# Altium schematic sheet TIA.SchDoc: 08 - Fotodeteccao InGaAs e filtro
size A3; Project: CM5 Photonic Bias Controller; DocumentRev: R5; ProjectRev: R5; Version: Rev R6; SheetNumber: 9; SheetTotal: 17; Author: Carlos Renan; SCH_SCALE: N/A; Address1: UFCG; Address2: Referencia: VIRTUS CC; Address3: Campina Grande - PB; ProjectName: Controle automatico de BIAS para MZM/IQ - Projeto 3; DocumentName: TIA.SchDoc
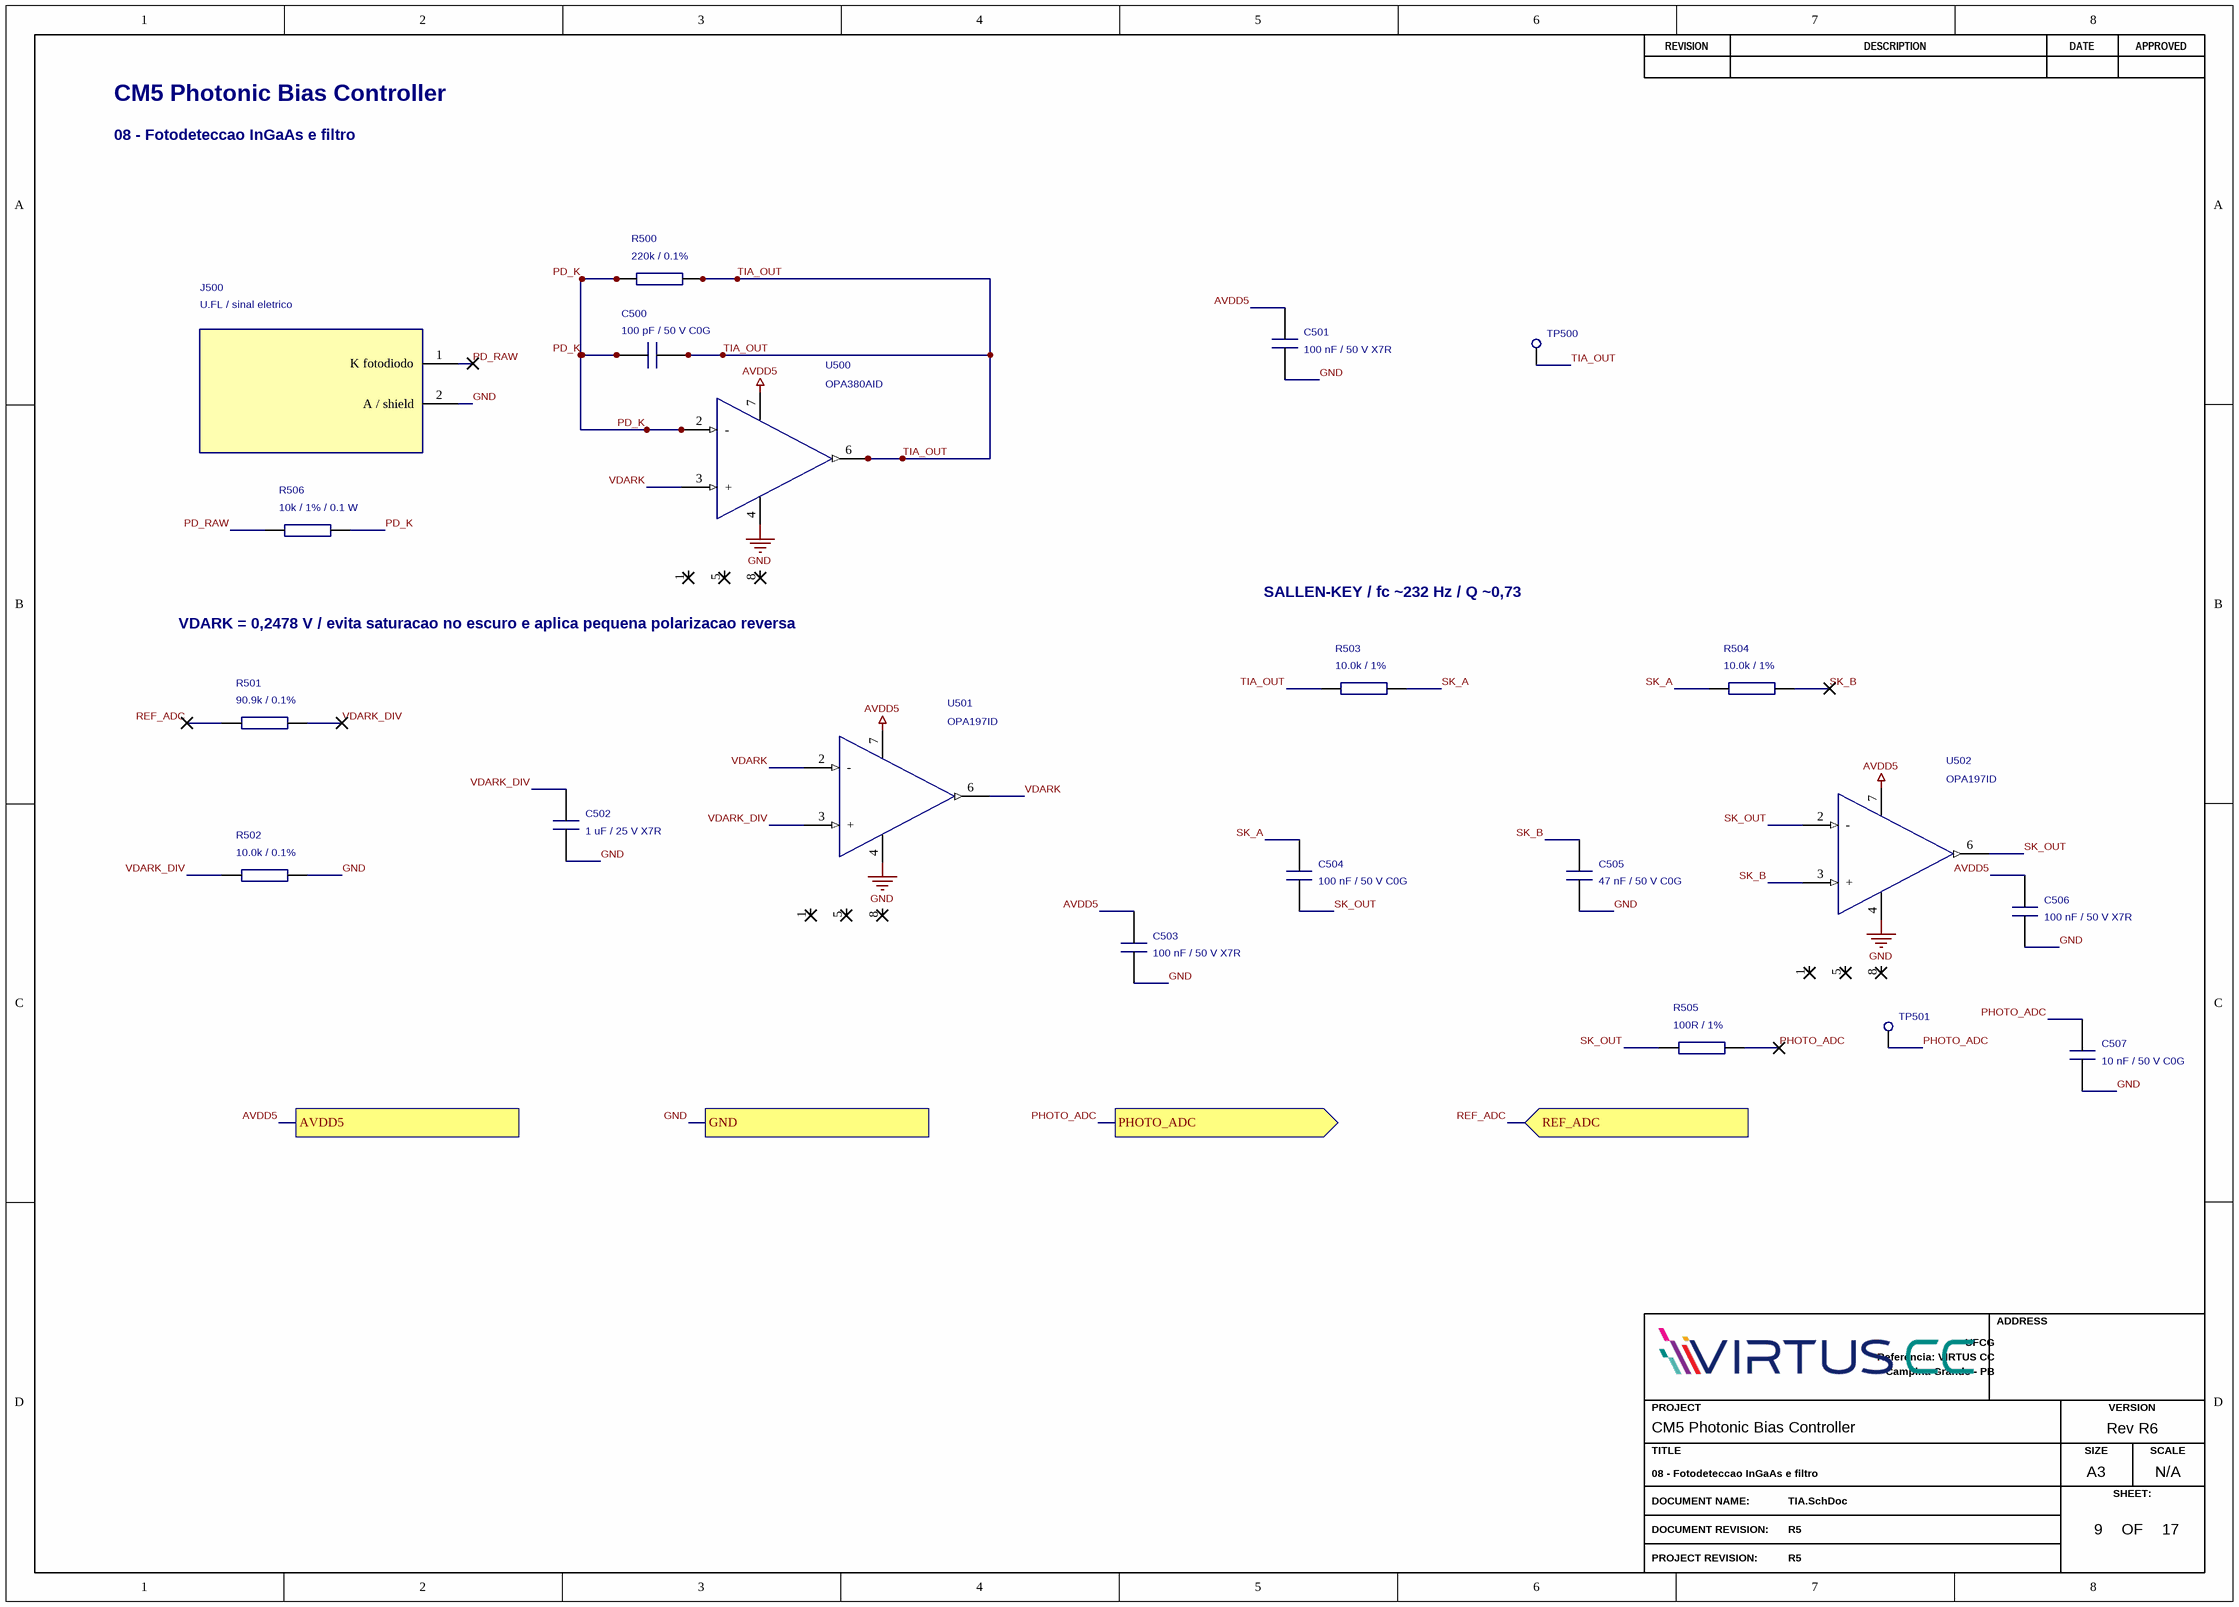
[diagram p0: TIA.SchDoc]

## Parts
C500  100 pF / 50 V C0G  [C0805]
C501  100 nF / 50 V X7R  [C0805]
C502  1 uF / 25 V X7R  [C0805]
C503  100 nF / 50 V X7R  [C0805]
C504  100 nF / 50 V C0G  [C1206]
C505  47 nF / 50 V C0G  [C1206]
C506  100 nF / 50 V X7R  [C0805]
C507  10 nF / 50 V C0G  [C0805]
J500  U.FL / sinal eletrico  [HIROSE_UFL]
R500  220k / 0.1%  [R-0603]
R501  90.9k / 0.1%  [R-0603]
R502  10.0k / 0.1%  [R-0603]
R503  10.0k / 1%  [R-0603]
R504  10.0k / 1%  [R-0603]
R505  100R / 1%  [R-0603]
R506  10k / 1% / 0.1 W  [R-0603]
TP500  Testpoint  [TP06R]  (value not drawn)
TP501  Testpoint  [TP06R]  (value not drawn)
U500  OPA380AID  [SOIC8]
U501  OPA197ID  [SOIC8]
U502  OPA197ID  [SOIC8]

## Ports
AVDD5, GND, PHOTO_ADC (out), REF_ADC (in)

## Nets
AVDD5: C501.1 C503.1 C506.1 U500.7(V+) U501.7(V+) U502.7(V+) ; port AVDD5
GND: C501.2 C502.2 C503.2 C505.2 C506.2 C507.2 J500.2(A_/_shield) R502.2 U500.4(V-) U501.4(V-) U502.4(V-) ; port GND
PD_K: C500.1 R500.1 R506.2 U500.2(-)
PD_RAW: J500.1(K_fotodiodo) R506.1
PHOTO_ADC: C507.1 R505.2 TP501.1(TP) ; port PHOTO_ADC
REF_ADC: R501.1 ; port REF_ADC
SK_A: C504.1 R503.2 R504.1
SK_B: C505.1 R504.2 U502.3(+)
SK_OUT: C504.2 R505.1 U502.2(-) U502.6(OUT)
TIA_OUT: C500.2 R500.2 R503.1 TP500.1(TP) U500.6(OUT)
VDARK: U500.3(+) U501.2(-) U501.6(OUT)
VDARK_DIV: C502.1 R501.2 R502.1 U501.3(+)

Not connected (* = marked no-connect by the designer): U500 1(NC)* 5(NC)* 8(NC)*; U501 1(NC)* 5(NC)* 8(NC)*; U502 1(NC)* 5(NC)* 8(NC)*

## Notes on the sheet
- CM5 Photonic Bias Controller
- 08 - Fotodeteccao InGaAs e filtro
- SALLEN-KEY / fc ~232 Hz / Q ~0,73
- (near U500) VDARK = 0,2478 V / evita saturacao no escuro e aplica pequena polarizacao reversa
- REVISION
- DESCRIPTION
- DATE
- APPROVED
- ADDRESS
- PROJECT
- VERSION
- TITLE
- A3
- SIZE
- SCALE
- DOCUMENT NAME:
- DOCUMENT REVISION:
- OF
- SHEET:
- PROJECT REVISION:

## Library data of the parts
C500 = 100 pF: Manufacturer: KEMET; Manufacturer Part Number: C0805C101J5GACTU; Procurement Status: Busca por MPN; SKU e disponibilidade a confirmar; BOM Purchase: Yes; Manufacturer 1: KEMET; Manufacturer Part Number 1: C0805C101J5GACTU; Supplier 1: DigiKey; Supplier URL 1: https://www.digikey.com.br/pt/products/result?keywords=C0805C101J5GACTU; Supplier 2: Mouser; Supplier URL 2: https://br.mouser.com/c/?q=C0805C101J5GACTU; Datasheet: https://www.yageogroup.com/download/specsheet/C0805C101J5GACTU
C501 C503 C506 = 100 nF: Manufacturer: KEMET; Manufacturer Part Number: C0805C104K5RACTU; Procurement Status: Busca por MPN; SKU e disponibilidade a confirmar; BOM Purchase: Yes; Manufacturer 1: KEMET; Manufacturer Part Number 1: C0805C104K5RACTU; Supplier 1: DigiKey; Supplier URL 1: https://www.digikey.com.br/pt/products/result?keywords=C0805C104K5RACTU; Supplier 2: Mouser; Supplier URL 2: https://br.mouser.com/c/?q=C0805C104K5RACTU; Datasheet: https://www.yageogroup.com/download/specsheet/C0805C104K5RACTU
C502 = 1 uF: Manufacturer: KEMET; Manufacturer Part Number: C0805C105K3RACTU; Procurement Status: Busca por MPN; SKU e disponibilidade a confirmar; BOM Purchase: Yes; Manufacturer 1: KEMET; Manufacturer Part Number 1: C0805C105K3RACTU; Supplier 1: DigiKey; Supplier URL 1: https://www.digikey.com.br/pt/products/result?keywords=C0805C105K3RACTU; Supplier 2: Mouser; Supplier URL 2: https://br.mouser.com/c/?q=C0805C105K3RACTU; Datasheet: https://www.yageogroup.com/download/specsheet/C0805C105K3RACTU
C504 = 100 nF: Manufacturer: KEMET; Manufacturer Part Number: C1206C104J5GACTU; Procurement Status: Busca por MPN; SKU e disponibilidade a confirmar; BOM Purchase: Yes; Manufacturer 1: KEMET; Manufacturer Part Number 1: C1206C104J5GACTU; Supplier 1: DigiKey; Supplier URL 1: https://www.digikey.com.br/pt/products/result?keywords=C1206C104J5GACTU; Supplier 2: Mouser; Supplier URL 2: https://br.mouser.com/c/?q=C1206C104J5GACTU; Datasheet: https://www.yageogroup.com/download/specsheet/C1206C104J5GACTU
C505 = 47 nF: Manufacturer: KEMET; Manufacturer Part Number: C1206C473J5GACTU; Procurement Status: Busca por MPN; SKU e disponibilidade a confirmar; BOM Purchase: Yes; Manufacturer 1: KEMET; Manufacturer Part Number 1: C1206C473J5GACTU; Supplier 1: DigiKey; Supplier URL 1: https://www.digikey.com.br/pt/products/result?keywords=C1206C473J5GACTU; Supplier 2: Mouser; Supplier URL 2: https://br.mouser.com/c/?q=C1206C473J5GACTU; Datasheet: https://www.yageogroup.com/download/specsheet/C1206C473J5GACTU
C507 = 10 nF: Manufacturer: KEMET; Manufacturer Part Number: C0805C103J5GACTU; Procurement Status: Busca por MPN; SKU e disponibilidade a confirmar; BOM Purchase: Yes; Manufacturer 1: KEMET; Manufacturer Part Number 1: C0805C103J5GACTU; Supplier 1: DigiKey; Supplier URL 1: https://www.digikey.com.br/pt/products/result?keywords=C0805C103J5GACTU; Supplier 2: Mouser; Supplier URL 2: https://br.mouser.com/c/?q=C0805C103J5GACTU; Datasheet: https://www.yageogroup.com/download/specsheet/C0805C103J5GACTU
J500 = U.FL: Manufacturer: Hirose; Manufacturer Part Number: U.FL-R-SMT-1(10); Review: Centro=1; pads de blindagem=2; conector eletrico do fotodiodo externo.; Procurement Status: Busca por MPN; SKU e disponibilidade a confirmar; BOM Purchase: Yes; Manufacturer 1: Hirose; Manufacturer Part Number 1: U.FL-R-SMT-1(10); Supplier 1: DigiKey; Supplier URL 1: https://www.digikey.com.br/pt/products/result?keywords=U.FL-R-SMT-1%2810%29; Supplier 2: Mouser; Supplier URL 2: https://br.mouser.com/c/?q=U.FL-R-SMT-1%2810%29; Datasheet: https://www.hirose.com/product/series/U.FL
R500 = 220k: Manufacturer: YAGEO; Manufacturer Part Number: RT0603BRD07220KL; Review: Filme fino, 0,1%, 25 ppm/K; 0,1 W. Verificar dissipacao em R210/R212 e matching dos drivers.; Procurement Status: Busca por MPN; SKU e disponibilidade a confirmar; BOM Purchase: Yes; Manufacturer 1: YAGEO; Manufacturer Part Number 1: RT0603BRD07220KL; Supplier 1: DigiKey; Supplier URL 1: https://www.digikey.com.br/pt/products/result?keywords=RT0603BRD07220KL; Supplier 2: Mouser; Supplier URL 2: https://br.mouser.com/c/?q=RT0603BRD07220KL; Datasheet: https://www.yageo.com/en/Product/Index/rchip
R501 = 90.9k: Manufacturer: YAGEO; Manufacturer Part Number: RT0603BRD0790K9L; Review: Filme fino, 0,1%, 25 ppm/K; 0,1 W. Verificar dissipacao em R210/R212 e matching dos drivers.; Procurement Status: SKU conferido; consultar disponibilidade; BOM Purchase: Yes; Manufacturer 1: YAGEO; Manufacturer Part Number 1: RT0603BRD0790K9L; Supplier 1: DigiKey; Supplier Part Number 1: YAG1747CT-ND; Supplier URL 1: https://www.digikey.com.br/en/products/detail/yageo/RT0603BRD0790K9L/1072677; Supplier 2: Mouser; Supplier URL 2: https://br.mouser.com/c/?q=RT0603BRD0790K9L; Datasheet: https://www.yageo.com/en/Product/Index/rchip
R502 = 10.0k: Manufacturer: YAGEO; Manufacturer Part Number: RT0603BRD0710KL; Review: Filme fino, 0,1%, 25 ppm/K; 0,1 W. Verificar dissipacao em R210/R212 e matching dos drivers.; Procurement Status: Busca por MPN; SKU e disponibilidade a confirmar; BOM Purchase: Yes; Manufacturer 1: YAGEO; Manufacturer Part Number 1: RT0603BRD0710KL; Supplier 1: DigiKey; Supplier URL 1: https://www.digikey.com.br/pt/products/result?keywords=RT0603BRD0710KL; Supplier 2: Mouser; Supplier URL 2: https://br.mouser.com/c/?q=RT0603BRD0710KL; Datasheet: https://www.yageo.com/en/Product/Index/rchip
R503 R504 = 10.0k: Manufacturer: YAGEO; Manufacturer Part Number: RC0603FR-0710KL; Procurement Status: Busca por MPN; SKU e disponibilidade a confirmar; BOM Purchase: Yes; Manufacturer 1: YAGEO; Manufacturer Part Number 1: RC0603FR-0710KL; Supplier 1: DigiKey; Supplier URL 1: https://www.digikey.com.br/pt/products/result?keywords=RC0603FR-0710KL; Supplier 2: Mouser; Supplier URL 2: https://br.mouser.com/c/?q=RC0603FR-0710KL; Datasheet: https://www.yageo.com/en/Product/Index/rchip
R505 = 100R: Manufacturer: YAGEO; Manufacturer Part Number: RC0603FR-07100RL; Procurement Status: Busca por MPN; SKU e disponibilidade a confirmar; BOM Purchase: Yes; Manufacturer 1: YAGEO; Manufacturer Part Number 1: RC0603FR-07100RL; Supplier 1: DigiKey; Supplier URL 1: https://www.digikey.com.br/pt/products/result?keywords=RC0603FR-07100RL; Supplier 2: Mouser; Supplier URL 2: https://br.mouser.com/c/?q=RC0603FR-07100RL; Datasheet: https://www.yageo.com/en/Product/Index/rchip
R506 = 10k: Manufacturer: YAGEO; Manufacturer Part Number: RC0603FR-0710KL; Procurement Status: Busca por MPN; SKU e disponibilidade a confirmar; BOM Purchase: Yes; Manufacturer 1: YAGEO; Manufacturer Part Number 1: RC0603FR-0710KL; Supplier 1: DigiKey; Supplier URL 1: https://www.digikey.com.br/pt/products/result?keywords=RC0603FR-0710KL; Supplier 2: Mouser; Supplier URL 2: https://br.mouser.com/c/?q=RC0603FR-0710KL; Datasheet: https://www.yageo.com/en/Product/Index/rchip
TP500 TP501 = Testpoint: Review: Testpoint em cobre; excluido da BOM de compra.; Procurement Status: Recurso de cobre da PCB; nao comprar; BOM Purchase: No - PCB feature
U500 = OPA380AID: Manufacturer: Texas Instruments; Procurement Status: Busca por MPN; SKU e disponibilidade a confirmar; BOM Purchase: Yes; Manufacturer Part Number: OPA380AID; Manufacturer 1: Texas Instruments; Manufacturer Part Number 1: OPA380AID; Supplier 1: DigiKey; Supplier URL 1: https://www.digikey.com.br/pt/products/result?keywords=OPA380AID; Supplier 2: Mouser; Supplier URL 2: https://br.mouser.com/c/?q=OPA380AID; Datasheet: https://www.ti.com/lit/ds/symlink/opa380.pdf
U501 U502 = OPA197ID: Manufacturer: Texas Instruments; Procurement Status: Busca por MPN; SKU e disponibilidade a confirmar; BOM Purchase: Yes; Manufacturer Part Number: OPA197ID; Manufacturer 1: Texas Instruments; Manufacturer Part Number 1: OPA197ID; Supplier 1: DigiKey; Supplier URL 1: https://www.digikey.com.br/pt/products/result?keywords=OPA197ID; Supplier 2: Mouser; Supplier URL 2: https://br.mouser.com/c/?q=OPA197ID; Datasheet: https://www.ti.com/lit/ds/symlink/opa197.pdf